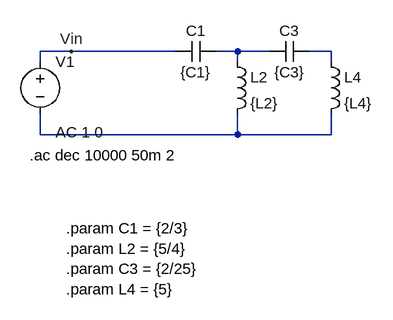
[diagram p0: schematic cauer_DC.asc]
cauer_DC.asc, the LTspice schematic file:
Version 4.1
SHEET 1 880 680
WIRE 0 144 -48 144
WIRE 160 144 0 144
WIRE 256 144 224 144
WIRE 304 144 256 144
WIRE 400 144 368 144
WIRE -48 160 -48 144
WIRE 256 160 256 144
WIRE 400 160 400 144
WIRE -48 272 -48 240
WIRE 256 272 256 240
WIRE 256 272 -48 272
WIRE 400 272 400 240
WIRE 400 272 256 272
FLAG 0 144 Vin
SYMBOL voltage -48 144 R0
WINDOW 123 24 124 Left 2
WINDOW 39 0 0 Left 0
SYMATTR Value2 AC 1 0
SYMATTR InstName V1
SYMATTR Value ""
SYMBOL cap 224 128 R90
WINDOW 0 0 32 VBottom 2
WINDOW 3 32 32 VTop 2
SYMATTR InstName C1
SYMATTR Value {C1}
SYMBOL ind 240 144 R0
SYMATTR InstName L2
SYMATTR Value {L2}
SYMATTR SpiceLine Rser=1m
SYMBOL cap 368 128 R90
WINDOW 0 0 32 VBottom 2
WINDOW 3 32 32 VTop 2
SYMATTR InstName C3
SYMATTR Value {C3}
SYMBOL ind 384 144 R0
SYMATTR InstName L4
SYMATTR Value {L4}
SYMATTR SpiceLine Rser=1m
TEXT -64 304 Left 2 !.ac dec 10000 50m 2
TEXT -8 416 Left 2 !.param C1 = {2/3}\n.param L2 = {5/4}\n.param C3 = {2/25}\n.param L4 = {5}

The netlist it stands for:
* cauer_DC.asc
V1 Vin N003 AC 1 0
C1 N001 Vin {C1}
L2 N001 N003 {L2} Rser=1m
C3 N002 N001 {C3}
L4 N002 N003 {L4} Rser=1m
.ac dec 10000 50m 2
.param C1 = {2/3}
.param L2 = {5/4}
.param C3 = {2/25}
.param L4 = {5}
.backanno
.end